# Altium project Zotino-DIOT.PrjPCB (part 3 of 5)

## Sheet DAC_32CH.SchDoc: DAC
size 420 x 297 mm; Author: G.K.; CompanyName: WUT; DrawnBy: G.K.; Organization: WUT ISE; Address1: Warsaw Univeristy of Technology; Address2: Nowowiejska 15/19; DocumentNumber: 3; Revision: 1.4.3; SheetNumber: 3; SheetTotal: 6; EDA_Number: ARTIQ; Projet: Zotino; ModifiedBy: -; CreateDate: XX/XX/XXXX; CheckedDate: -; Title2: & reference; DivGrp: ISE; Designer: G.K.; ModifiedDate: -; ProjectName: 32 CHANNEL 16bit DAC
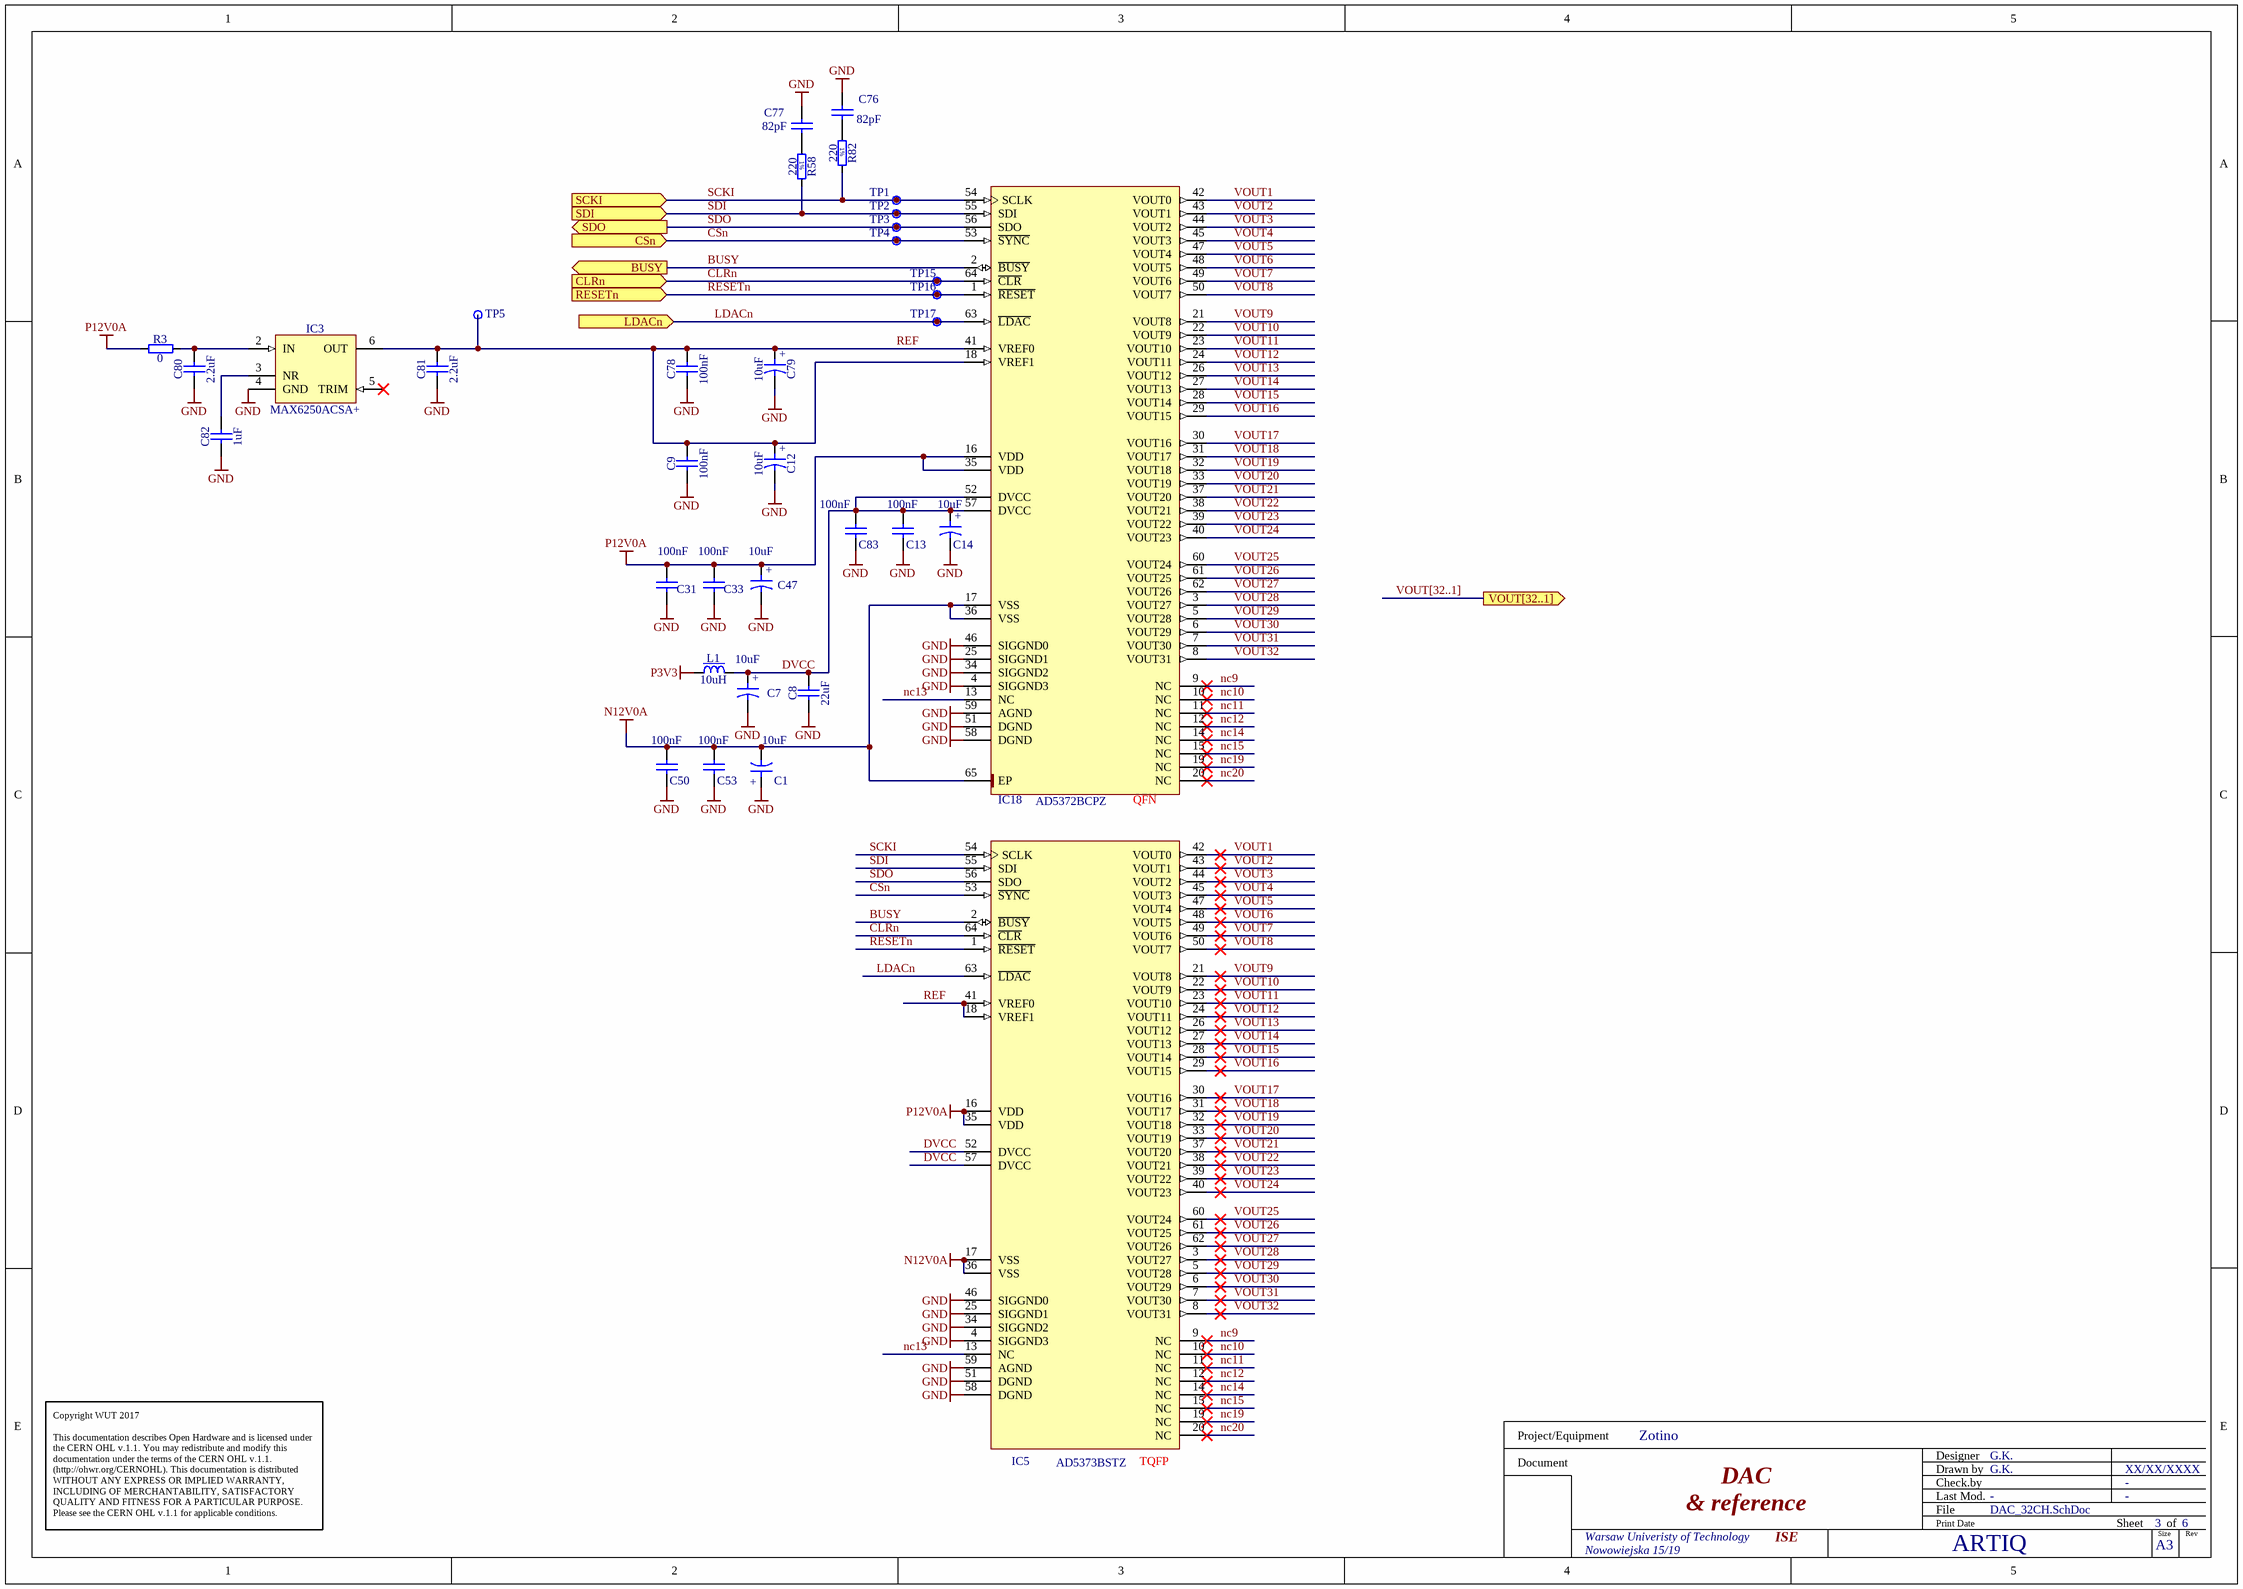
[diagram p3: DAC_32CH.SchDoc]

### Parts
C1  10uF  [CAPMP3216X180N]
C7  10uF  [CAPMP3216X180N]
C8  22uF  [CAPC2012X135N]
C9  100nF  [CAPC1005X55N]
C12  10uF  [CAPMP3216X180N]
C13  100nF  [CAPC1005X55N]
C14  10uF  [CAPMP3216X180N]
C31  100nF  [CAPC1005X55N]
C33  100nF  [CAPC1005X55N]
C47  10uF  [CAPMP3216X180N]
C50  100nF  [CAPC1005X55N]
C53  100nF  [CAPC1005X55N]
C76  82pF  [CAPC1608X87N]
C77  82pF  [CAPC1608X87N]
C78  100nF  [CAPC1005X55N]
C79  10uF  [CAPMP3216X180N]
C80  2.2uF  [CAPC1608X87N]
C81  2.2uF  [CAPC1608X87N]
C82  1uF  [CAPC1608X87N]
C83  100nF  [CAPC1005X55N]
IC3  MAX6250ACSA+  [SOIC127P600X175-8N]
IC5  AD5373BSTZ  [TSQFP50P1200X1200X160-64L]
IC18  AD5372BCPZ  [QFN50P900X900X100-65N-S725]
L1  10uH  [IND_MURATA-PS_8400]
R3  0  [RESC1005X40N]
R58  220  [RESC1608X55N]
R82  220  [RESC1608X55N]
TP1  Test Point  [TPS127]  (value not drawn)  (no BOM)
TP2  Test Point  [TPS127]  (value not drawn)  (no BOM)
TP3  Test Point  [TPS127]  (value not drawn)  (no BOM)
TP4  Test Point  [TPS127]  (value not drawn)  (no BOM)
TP5  Test Point  [TPS127]  (value not drawn)  (no BOM)
TP15  Test Point  [TPS127]  (value not drawn)  (no BOM)
TP16  Test Point  [TPS127]  (value not drawn)  (no BOM)
TP17  Test Point  [TPS127]  (value not drawn)  (no BOM)

### Ports
BUSY (out), CLRn (in), CSn (in), LDACn (in), RESETn (in), SCKI (in), SDI (in), SDO (out), VOUT[32..1] (out)

### Nets
GND: C1.1 C7.2 C8.1 C9.1 C12.2 C13.1 C14.2 C31.1 C33.1 C47.2 C50.1 C53.1 C76.1 C77.1 C78.1 C79.2 C80.1 C81.1 C82.1 C83.1 IC3.4(GND) IC5.4(SIGGND3) IC5.25(SIGGND1) IC5.34(SIGGND2) IC5.46(SIGGND0) IC5.51(DGND) IC5.58(DGND) IC5.59(AGND) IC18.4(SIGGND3) IC18.25(SIGGND1) IC18.34(SIGGND2) IC18.46(SIGGND0) IC18.51(DGND) IC18.58(DGND) IC18.59(AGND)
N12V0A: C1.2 C50.2 C53.2 IC5.17(VSS) IC5.36(VSS) IC18.17(VSS) IC18.36(VSS) IC18.65(EP)
P3V3: L1.1
P12V0A: C31.2 C33.2 C47.1 IC5.16(VDD) IC5.35(VDD) IC18.16(VDD) IC18.35(VDD) R3.1
BUSY: IC5.2(~{BUSY}) IC18.2(~{BUSY}) ; port BUSY
CLRn: IC5.64(~{CLR}) IC18.64(~{CLR}) TP15.1 ; port CLRn
CSn: IC5.53(~{SYNC}) IC18.53(~{SYNC}) TP4.1 ; port CSn
DVCC: C7.1 C8.2 C13.2 C14.1 C83.2 IC5.52(DVCC) IC5.57(DVCC) IC18.52(DVCC) IC18.57(DVCC) L1.2
LDACn: IC5.63(~{LDAC}) IC18.63(~{LDAC}) TP17.1 ; port LDACn
nc9: IC5.9(NC) IC18.9(NC)
nc10: IC5.10(NC) IC18.10(NC)
nc11: IC5.11(NC) IC18.11(NC)
nc12: IC5.12(NC) IC18.12(NC)
nc13: IC5.13(NC) IC18.13(NC)
nc14: IC5.14(NC) IC18.14(NC)
nc15: IC5.15(NC) IC18.15(NC)
nc19: IC5.19(NC) IC18.19(NC)
nc20: IC5.20(NC) IC18.20(NC)
REF: C9.2 C12.1 C78.2 C79.1 C81.2 IC3.6(OUT) IC5.18(VREF1) IC5.41(VREF0) IC18.18(VREF1) IC18.41(VREF0) TP5.1
RESETn: IC5.1(~{RESET}) IC18.1(~{RESET}) TP16.1 ; port RESETn
SCKI: IC5.54(SCLK) IC18.54(SCLK) R82.2 TP1.1 ; port SCKI
SDI: IC5.55(SDI) IC18.55(SDI) R58.2 TP2.1 ; port SDI
SDO: IC5.56(SDO) IC18.56(SDO) TP3.1 ; port SDO
VOUT1: IC5.42(VOUT0) IC18.42(VOUT0)
VOUT2: IC5.43(VOUT1) IC18.43(VOUT1)
VOUT3: IC5.44(VOUT2) IC18.44(VOUT2)
VOUT4: IC5.45(VOUT3) IC18.45(VOUT3)
VOUT5: IC5.47(VOUT4) IC18.47(VOUT4)
VOUT6: IC5.48(VOUT5) IC18.48(VOUT5)
VOUT7: IC5.49(VOUT6) IC18.49(VOUT6)
VOUT8: IC5.50(VOUT7) IC18.50(VOUT7)
VOUT9: IC5.21(VOUT8) IC18.21(VOUT8)
VOUT10: IC5.22(VOUT9) IC18.22(VOUT9)
VOUT11: IC5.23(VOUT10) IC18.23(VOUT10)
VOUT12: IC5.24(VOUT11) IC18.24(VOUT11)
VOUT13: IC5.26(VOUT12) IC18.26(VOUT12)
VOUT14: IC5.27(VOUT13) IC18.27(VOUT13)
VOUT15: IC5.28(VOUT14) IC18.28(VOUT14)
VOUT16: IC5.29(VOUT15) IC18.29(VOUT15)
VOUT17: IC5.30(VOUT16) IC18.30(VOUT16)
VOUT18: IC5.31(VOUT17) IC18.31(VOUT17)
VOUT19: IC5.32(VOUT18) IC18.32(VOUT18)
VOUT20: IC5.33(VOUT19) IC18.33(VOUT19)
VOUT21: IC5.37(VOUT20) IC18.37(VOUT20)
VOUT22: IC5.38(VOUT21) IC18.38(VOUT21)
VOUT23: IC5.39(VOUT22) IC18.39(VOUT22)
VOUT24: IC5.40(VOUT23) IC18.40(VOUT23)
VOUT25: IC5.60(VOUT24) IC18.60(VOUT24)
VOUT26: IC5.61(VOUT25) IC18.61(VOUT25)
VOUT27: IC5.62(VOUT26) IC18.62(VOUT26)
VOUT28: IC5.3(VOUT27) IC18.3(VOUT27)
VOUT29: IC5.5(VOUT28) IC18.5(VOUT28)
VOUT30: IC5.6(VOUT29) IC18.6(VOUT29)
VOUT31: IC5.7(VOUT30) IC18.7(VOUT30)
VOUT32: IC5.8(VOUT31) IC18.8(VOUT31)
NetC76_2: C76.2 R82.1
NetC77_2: C77.2 R58.1
NetC80_2: C80.2 IC3.2(IN) R3.2
NetC82_2: C82.2 IC3.3(NR)

Not connected (* = marked no-connect by the designer): IC3 5(TRIM)*

### Buses and harness runs
bus VOUT[32..1] = port VOUT[32..1]

### Notes on the sheet
- (near IC18) QFN
- (near IC5) TQFP
- Copyright WUT 2017
  This documentation describes Open Hardware and is licensed under the CERN OHL v.1.1. You may redistribute and modify this documentation under the terms of the CERN OHL v.1.1. (http://ohwr.org/CERNOHL). This documentation is distributed WITHOUT ANY EXPRESS OR IMPLIED WARRANTY, INCLUDING OF MERCHANTABILITY, SATISFACTORY QUALITY AND FITNESS FOR A PARTICULAR PURPOSE. Please see the CERN OHL v.1.1 for applicable conditions.
- Project/Equipment
- Document
- Designer
- Drawn by
- Check.by
- File
- Last Mod.
- Print Date
- Sheet
- Size
- A3
- of
- Rev
- (in symbol CTE3216-18_10UF_16V_20%_AVX_TCJ) +
- (in symbol R0603_220R_1%_0.1W_100PPM) 1%

### Library data of the parts
C1 C7 C12 C14 C47 C79 = CTE3216-18_10UF_16V_20%_AVX_TCJ: Polarised capacitor; Part Description: ESR 0R200 Tantalum Solid Electrolytic Chip Capacitor with Conductive Polymer Electrode; Manufacturer: AVX; Manufacturer Part Number: TCJA106M016R0200; Voltage: 16V; Tolerance: ±20%; Part Number: CTE3216-18_10UF_16V_20%_AVX_TCJ; Component Kind: Standard; Component Type: Standard; Pin Count: 2; Value: 10uF; Status: Preferred; Case: A; Mounted: Yes; Socket: No; SMD: Yes; Sense: No; ComponentHeight: 1.8mm; HelpURL: \\cern.ch\dfs\Applications\Altium\Datasheets\CTE_AVX_TCJ.pdf; Author: CERN DEM JLC; CreateDate: 29.03.2012; LatestRevisionDate: 29.03.2012
C8 = CC0805_22UF_16V_10%_X5R: Non-polarised capacitor; Part Description: SMD Multilayer Chip Ceramic Capacitor; Manufacturer: GENERIC; Manufacturer1 Part Number: C2012X5R1C226KT; Voltage: 16V; TC: X5R; Tolerance: ±10%; Part Number: CC0805_22UF_16V_10%_X5R; Component Kind: Standard; Component Type: Standard; Pin Count: 2; Value: 22uF; Status: Preferred; Manufacturer Part Number: CC0805_22UF_16V_10%_X5R; Case: 0805; Mounted: Yes; Socket: No; SMD: Yes; Sense: No; Manufacturer1 Example: TDK; Manufacturer1 ComponentHeight: 1.35mm; HelpURL: \\cern.ch\dfs\Applications\Altium\Datasheets\CC0805_X5R_TDK_C.pdf; Author: CERN DEM JLC; CreateDate: 25.10.2012; LatestRevisionDate: 25.10.2012
C9 C13 C31 C33 C50 C53 C78 C83 = CC0402_100NF_16V_10%_X7R: Non-polarised capacitor; Part Description: SMD Multilayer Chip Ceramic Capacitor; Manufacturer: GENERIC; Manufacturer1 Part Number: GRM155R71C104KA88D; Voltage: 16V; TC: X7R; Tolerance: ±10%; Part Number: CC0402_100NF_16V_10%_X7R; Component Kind: Standard; Component Type: Standard; Pin Count: 2; Value: 100nF; Status: Not Recommended; Manufacturer Part Number: CC0402_100NF_16V_10%_X7R; Case: 0402; Mounted: Yes; Socket: No; SMD: Yes; Sense: No; Manufacturer1 Example: MURATA; Manufacturer1 ComponentHeight: 0.55mm; HelpURL: \\cern.ch\dfs\Applications\Altium\Datasheets\CC0402_X7R_MURATA_GRM.pdf; Author: CERN DEM JLC
  C9 C78: CreateDate: 2013-12-05; LatestRevisionDate: 2007-12-03
  C13 C31 C33 C50 C53 C83: CreateDate: 05.12.2013; LatestRevisionDate: 03.12.2007
C76 C77 = CC0603_82PF_50V_5%_NP0: Non-polarised capacitor; Part Description: SMD Multilayer Chip Ceramic Capacitor; Manufacturer: GENERIC; Manufacturer1 Part Number: 223886715829; Voltage: 50V; TC: C0G/NP0; Tolerance: ±5%; Part Number: CC0603_82PF_50V_5%_NP0; Component Kind: Standard; Component Type: Standard; Pin Count: 2; Value: 82pF; Status: Preferred; Manufacturer Part Number: CC0603_82PF_50V_5%_NP0; Case: 0603; Mounted: Yes; Socket: No; SMD: Yes; Sense: No; Manufacturer1 Example: PHYCOMP; Manufacturer1 ComponentHeight: 0.87mm; HelpURL: \\cern.ch\dfs\Applications\Altium\Datasheets\CC0603_NP0_PHYCOMP.pdf; Author: CERN DEM JLC; CreateDate: 03.12.2007; LatestRevisionDate: 03.12.2007
C80 C81 = CC0603_2.2UF_16V_10%_X5R: Non-polarised capacitor; Part Description: SMD Multilayer Chip Ceramic Capacitor; Manufacturer: GENERIC; Manufacturer1 Part Number: CC0603KRX5R7BB225; Voltage: 16V; TC: X5R; Tolerance: ±10%; Part Number: CC0603_2.2UF_16V_10%_X5R; Component Kind: Standard; Component Type: Standard; Pin Count: 2; Value: 2.2uF; Status: Preferred; Manufacturer Part Number: CC0603_2.2UF_16V_10%_X5R; Case: 0603; Mounted: Yes; Socket: No; SMD: Yes; Sense: No; Manufacturer1 Example: YAGEO; Manufacturer1 ComponentHeight: 0.9mm; HelpURL: \\cern.ch\dfs\Applications\Altium\Datasheets\CC0805_X5R_PHYCOMP_HC.pdf; Author: CERN DEM JLC; CreateDate: 28.04.2011; LatestRevisionDate: 28.04.2011
C82 = CC0603_1UF_25V_10%_X7R: Non-polarised capacitor; Part Description: SMD Multilayer Chip Ceramic Capacitor; Manufacturer: GENERIC; Manufacturer1 Part Number: GRM188R71E105KA12D; Voltage: 25V; TC: X7R; Tolerance: ±10%; Part Number: CC0603_1UF_25V_10%_X7R; Component Kind: Standard; Component Type: Standard; Pin Count: 2; Value: 1uF; Status: None; Manufacturer Part Number: CC0603_1UF_25V_10%_X7R; Case: 0603; Mounted: Yes; Socket: No; SMD: Yes; Sense: No; Manufacturer1 Example: MURATA; Manufacturer1 ComponentHeight: 0.9mm; HelpURL: \\cern.ch\dfs\Applications\Altium\Datasheets\CC0603_X7R_MURATA.pdf; Author: CERN DEM JLC; CreateDate: 18.01.2011; LatestRevisionDate: 18.01.2011
IC3 = MAX6250ACSA+: 1ppm/°C, Low-Noise, Precision, +5.000V Voltage Reference; Manufacturer: MAXIM; PressFit: No; Bonding: No; Part Number: MAX6250ACSA+; Component Kind: Standard; Component Type: Standard; Device: MAX6250ACSA+; PackageDescription: SOIC 8, Pitch 1.27mm, Body 4x5mm, IPC Medium Density; Part Description: 1ppm/°C, Low-Noise, Precision, +5.000V Voltage Reference; Manufacturer Part Number: MAX6250ACSA+; Pin Count: 5; Case: SOIC8; Mounted: Yes; Socket: No; SMD: Yes; Sense: No; ComponentHeight: 1.75mm; HelpURL: \\cern.ch\dfs\Applications\Altium\Datasheets\MAX6250ACSA+.pdf; Author: CERN DEM JMW; CreateDate: 06.07.2015; LatestRevisionDate: 06.07.2015
IC5 = DAC_AD5372_QFP: 32-Channel, 16-Bit, Serial Input, Voltage Output Digital-to-Analog Converter; Manufacturer: ANALOG DEVICES; PressFit: No; Bonding: No; Part Number: AD5373BSTZ; Component Kind: Standard; Component Type: Standard; Device: AD5373BSTZ; PackageDescription: TSQFP, 64-Leads, Body 10.00x10.00mm, Pitch 0.50mm, IPC High Density; Part Description: 32-Channel, 16-Bit, Serial Input, Voltage Output Digital-to-Analog Converter; Manufacturer Part Number: AD5373BSTZ; Pin Count: 64; Case: QFN64; Mounted: Yes; Socket: No; SMD: Yes; Sense: No; ComponentHeight: 1mm; Author: GK; HelpURL: \\cern.ch\dfs\Applications\Altium\Datasheets\AD5373BCPZ.pdf; CreateDate: 14.03.2017; LatestRevisionDate: 14.03.2017
IC18 = DAC_AD5372: 32-Channel, 16-Bit, Serial Input, Voltage Output Digital-to-Analog Converter; Manufacturer: ANALOG DEVICES; PressFit: No; Bonding: No; Part Number: AD5372BCPZ; Component Kind: Standard; Component Type: Standard; Device: AD5372BCPZ; PackageDescription: QFN, 0.50mm Pitch, Square; 64 Pin, 9.00mm L X 9.00mm W X 1.00mm H Body (7.25 X 7.25mm Thermal Tab), IPC Medium Density; Part Description: 32-Channel, 16-Bit, Serial Input, Voltage Output Digital-to-Analog Converter; Manufacturer Part Number: AD5372BCPZ; Pin Count: 65; Case: QFN64; Mounted: Yes; Socket: No; SMD: Yes; Sense: No; ComponentHeight: 1mm; Author: GK; HelpURL: \\cern.ch\dfs\Applications\Altium\Datasheets\AD5373BCPZ.pdf; CreateDate: 14.03.2017; LatestRevisionDate: 14.03.2017
L1 = IND_10UH_10%_MURATA-PS_8400: Inductor With Core; Part Description: Miniature Surface Mount Power Inductor (8400 Serie); Manufacturer: MURATA POWER SOLUTIONS; Manufacturer Part Number: 84103C; Power: 950mA; Resistance: 0.24R; Tolerance: ±10%; Part Number: IND_10UH_10%_MURATA-PS_8400; Component Kind: Standard; Component Type: Standard; Pin Count: 2; Value: 10uH; Status: None; Mounted: Yes; Socket: No; SMD: Yes; Sense: No; ComponentHeight: 2.9mm; HelpURL: \\cern.ch\dfs\Applications\Altium\Datasheets\IND_MURATA-PS_8400.pdf; Author: CERN DEM JLC; CreateDate: 02.07.2012; LatestRevisionDate: 02.07.2012
R3 = R0402_0R_JUMPER: as R2 on sheet Supply_DAC; Part Number: R0402_0R_JUMPER; Component Kind: Standard; Component Type: Standard; Pin Count: 2; Value: 0; Status: Not recommended; Manufacturer Part Number: R0402_0R_JUMPER; Case: 0402; Mounted: Yes; Sense: No; Socket: No; SMD: Yes; Manufacturer1 Example: YAGEO PHYCOMP; Manufacturer1 ComponentHeight: 0.4mm; HelpURL: \\cern.ch\dfs\Applications\Altium\Datasheets\R0402_Phycomp_RC0402.pdf; Author: CERN DEM JLC; CreateDate: 03.12.2007; LatestRevisionDate: 17.10.2012
R58 R82 = R0603_220R_1%_0.1W_100PPM: Resistor - 1%; Part Description: General Purpose Thick Film Chip Resistor; Manufacturer: GENERIC; Manufacturer1 Part Number: NRC06F2200TRF; Power: 0.1W; TC: ±100ppm/°C; Part Number: R0603_220R_1%_0.1W_100PPM; Component Kind: Standard; Component Type: Standard; Pin Count: 2; Value: 220; Status: Preferred; Tolerance: ±1%; Manufacturer Part Number: R0603_220R_1%_0.1W_100PPM; Case: 0603; Mounted: Yes; Sense: No; Socket: No; SMD: Yes; Manufacturer1 Example: NIC COMPONENT; Manufacturer1 ComponentHeight: 0.55mm; HelpURL: \\cern.ch\dfs\Applications\Altium\Datasheets\R0603_NIC_NRC.pdf; Author: CERN DEM JLC; CreateDate: 03.12.2007; LatestRevisionDate: 13.03.2008
TP1-TP5 TP15-TP17 = SMD_PAD_1.27X1.27MM: as TP18 on sheet Zotino-DIOT; Part Number: SMD_PAD_1.27X1.27MM; Component Type: Standard (No BOM); Pin Count: 1; Family: Test Point; Socket: No; SMD: Yes; Sense: No; Status: None; ComponentHeight: 0mm; HelpURL: Undefined; Author: CERN DEM JLC; CreateDate: 12.01.2008; LatestRevisionDate: 12.01.2008; PackageDescription: 1.27mm x 1.27mm PCB Copper Area (SMD Test Point)

## Sheet LVDS_IFC_DAC.SchDoc: LVDS & I2C
size 420 x 297 mm; Author: G.K.; CompanyName: WUT; DrawnBy: G.K.; Organization: WUT ISE; Address1: Warsaw Univeristy of Technology; Address2: Nowowiejska 15/19; DocumentNumber: 2; Revision: 1.4.3; SheetNumber: 2; SheetTotal: 6; EDA_Number: ARTIQ; Projet: Zotino; ModifiedBy: -; CreateDate: XX/XX/XXXX; CheckedDate: -; Title2: interfaces; DivGrp: ISE; Designer: G.K.; SPICEModelCache: <root> / <DocumentId>IUEWJVWM</DocumentId> / <CacheFrame Number="0"> / <Model Name="pk14" Kind="CKT"> / <Text>*.INC dhvqfn.s / .SUBCKT pk14 / +    1   2   3   4   5   6   7   8   9  10 / +   11  12  13  14 / +   15  16  17  18  19  20  21  22  23  24 / +   25  26  27  28 / * Pin Resistance / r1 1 1001 9.078E-02 / r2 2 1002 8.829E-02 / r3 3 1003 8.731E-02 / r4 4 1004 8.710E-02 / r5 5 1005 8.731E-02 / r6 6 1006 8.829E-02 / r7 7 1007 9.075E-02 / r8 8 1008 9.072E-02 / r9 9 1009 8.809E-02 / r10 10 1010 8.716E-02 / r11 11 1011 8.706E-02 / r12 12 1012 8.720E-02 / r13 13 1013 8.816E-02 / r14 14 1014 9.068E-02 / * Pin Inductance / l1 1001 15 2.981E-09 / l2 1002 16 2.447E-09 / l3 1003 17 2.304E-09 / l4 1004 18 2.291E-09 / l5 1005 19 2.307E-09 / l6 1006 20 2.449E-09 / l7 1007 21 2.971E-09 / l8 1008 22 2.972E-09 / l9 1009 23 2.425E-09 / l10 1010 24 2.286E-09 / l11 1011 25 2.280E-09 / l12 1012 26 2.286E-09 / l13 1013 27 2.425E-09 / l14 1014 28 2.975E-09 / .ENDS pk14</Text> / </Model> / </CacheFrame> / </root>; ModifiedDate: -; ProjectName: 32 CHANNEL 16bit DAC
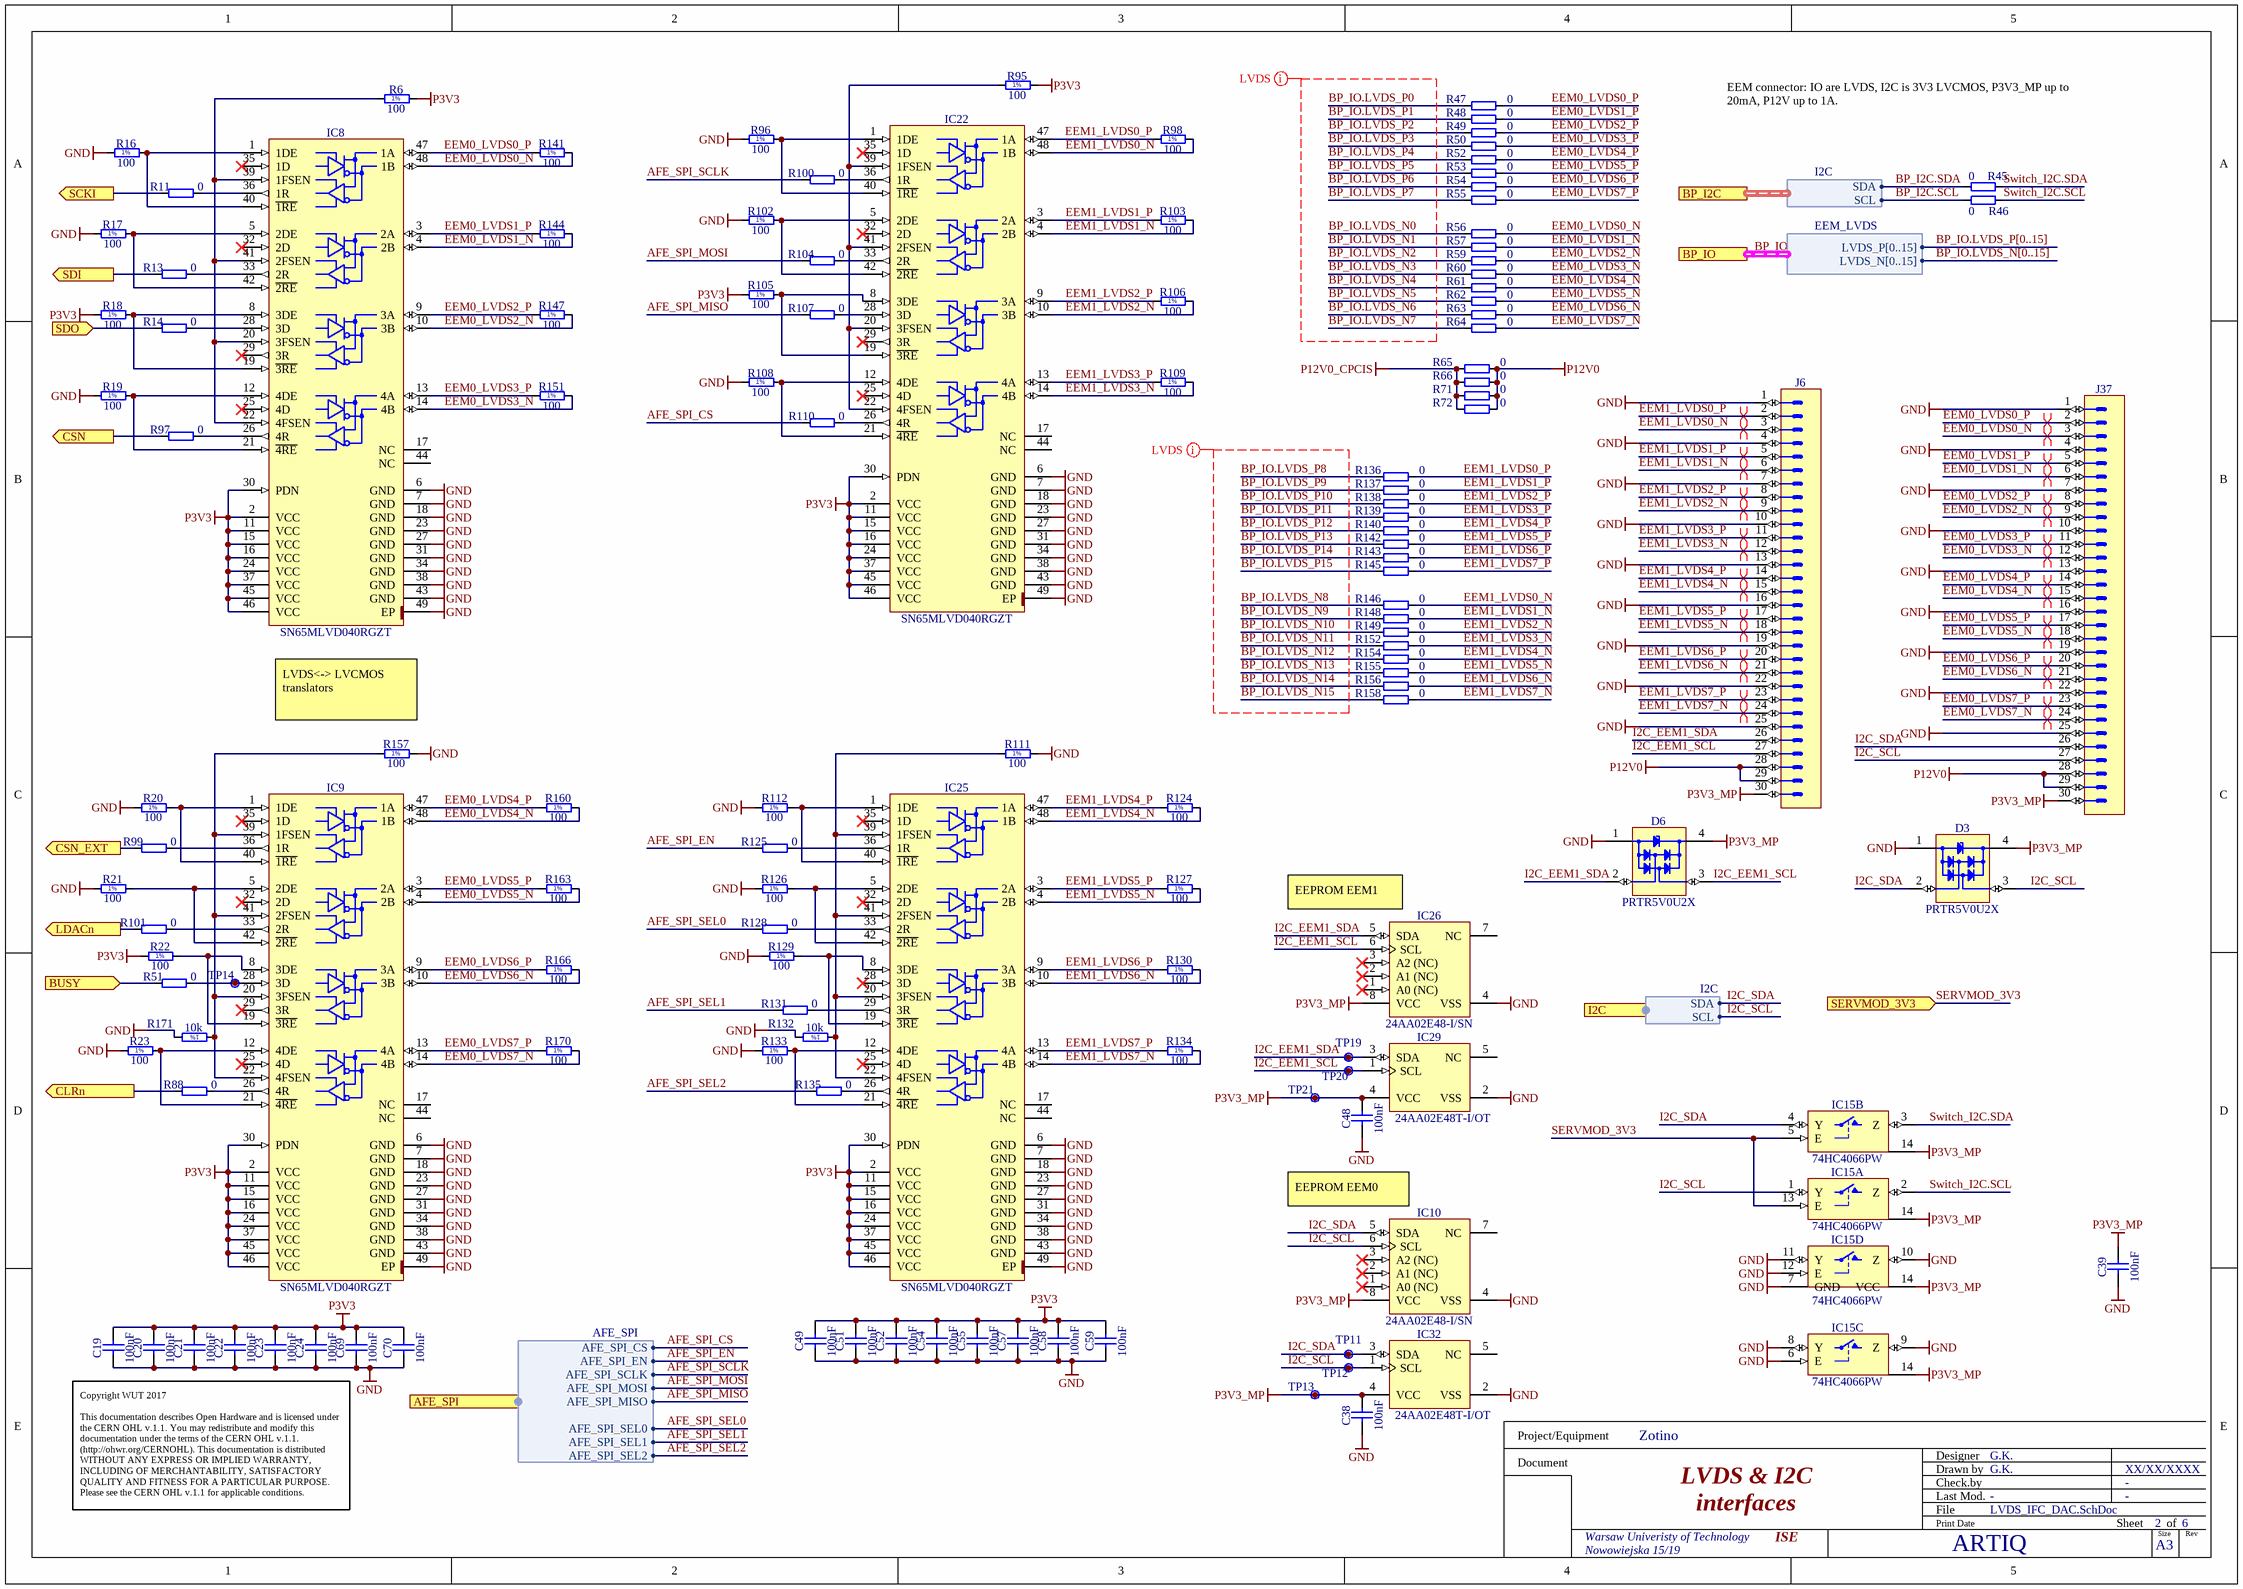
[diagram p4: LVDS_IFC_DAC.SchDoc]

### Parts
C19  100nF  [CAPC1005X55N]
C20  100nF  [CAPC1005X55N]
C21  100nF  [CAPC1005X55N]
C22  100nF  [CAPC1005X55N]
C23  100nF  [CAPC1005X55N]
C24  100nF  [CAPC1005X55N]
C38  100nF  [CAPC1005X55N]
C39  100nF  [CAPC1005X55N]
C48  100nF  [CAPC1005X55N]
C49  100nF  [CAPC1005X55N]
C51  100nF  [CAPC1005X55N]
C52  100nF  [CAPC1005X55N]
C54  100nF  [CAPC1005X55N]
C55  100nF  [CAPC1005X55N]
C57  100nF  [CAPC1005X55N]
C58  100nF  [CAPC1005X55N]
C59  100nF  [CAPC1005X55N]
C69  100nF  [CAPC1005X55N]
C70  100nF  [CAPC1005X55N]
D3  PRTR5V0U2X  [SOT190P230X110-4N]
D6  PRTR5V0U2X  [SOT190P230X110-4N]
IC8  SN65MLVD040RGZT  [QFN50P700X700X100-49N-S420]
IC9  SN65MLVD040RGZT  [QFN50P700X700X100-49N-S420]
IC10  24AA02E48-I/SN  [SOIC127P600X175-8N]
IC15  74HC4066PW  [SOP65P640X110-14N]  (parts A,B,C,D of 4)
IC22  SN65MLVD040RGZT  [QFN50P700X700X100-49N-S420]
IC25  SN65MLVD040RGZT  [QFN50P700X700X100-49N-S420]
IC26  24AA02E48-I/SN  [SOIC127P600X175-8N]
IC29  24AA02E48T-I/OT  [SOT95P280X145-5N]
IC32  24AA02E48T-I/OT  [SOT95P280X145-5N]
J6  (no value)  [3M_N2530-6002RB]
J37  (no value)  [3M_N2530-6002RB]
R6  100  [RESC1005X40N]
R11  0  [RESC1005X40N]
R13  0  [RESC1005X40N]
R14  0  [RESC1005X40N]
R16  100  [RESC1005X40N]
R17  100  [RESC1005X40N]
R18  100  [RESC1005X40N]
R19  100  [RESC1005X40N]
R20  100  [RESC1005X40N]
R21  100  [RESC1005X40N]
R22  100  [RESC1005X40N]
R23  100  [RESC1005X40N]
R45  0  [RESC1005X40N]
R46  0  [RESC1005X40N]
R47  0  [RESC1005X40N]
R48  0  [RESC1005X40N]
R49  0  [RESC1005X40N]
R50  0  [RESC1005X40N]
R51  0  [RESC1005X40N]
R52  0  [RESC1005X40N]
R53  0  [RESC1005X40N]
R54  0  [RESC1005X40N]
R55  0  [RESC1005X40N]
R56  0  [RESC1005X40N]
R57  0  [RESC1005X40N]
R59  0  [RESC1005X40N]
R60  0  [RESC1005X40N]
R61  0  [RESC1005X40N]
R62  0  [RESC1005X40N]
R63  0  [RESC1005X40N]
R64  0  [RESC1005X40N]
R65  0  [RESC1005X40N]
R66  0  [RESC1005X40N]
R71  0  [RESC1005X40N]
R72  0  [RESC1005X40N]
R88  0  [RESC1005X40N]
R95  100  [RESC1005X40N]
R96  100  [RESC1005X40N]
R97  0  [RESC1005X40N]
R98  100  [RESC1005X40N]
R99  0  [RESC1005X40N]
R100  0  [RESC1005X40N]
R101  0  [RESC1005X40N]
R102  100  [RESC1005X40N]
R103  100  [RESC1005X40N]
R104  0  [RESC1005X40N]
R105  100  [RESC1005X40N]
R106  100  [RESC1005X40N]
R107  0  [RESC1005X40N]
R108  100  [RESC1005X40N]
R109  100  [RESC1005X40N]
R110  0  [RESC1005X40N]
R111  100  [RESC1005X40N]
R112  100  [RESC1005X40N]
R124  100  [RESC1005X40N]
R125  0  [RESC1005X40N]
R126  100  [RESC1005X40N]
R127  100  [RESC1005X40N]
R128  0  [RESC1005X40N]
R129  100  [RESC1005X40N]
R130  100  [RESC1005X40N]
R131  0  [RESC1005X40N]
R132  10k  [RESC1005X40N]
R133  100  [RESC1005X40N]
R134  100  [RESC1005X40N]
R135  0  [RESC1005X40N]
R136  0  [RESC1005X40N]
R137  0  [RESC1005X40N]
R138  0  [RESC1005X40N]
R139  0  [RESC1005X40N]
R140  0  [RESC1005X40N]
R141  100  [RESC1005X40N]
R142  0  [RESC1005X40N]
R143  0  [RESC1005X40N]
R144  100  [RESC1005X40N]
R145  0  [RESC1005X40N]
R146  0  [RESC1005X40N]
R147  100  [RESC1005X40N]
R148  0  [RESC1005X40N]
R149  0  [RESC1005X40N]
R151  100  [RESC1005X40N]
R152  0  [RESC1005X40N]
R154  0  [RESC1005X40N]
R155  0  [RESC1005X40N]
R156  0  [RESC1005X40N]
R157  100  [RESC1005X40N]
R158  0  [RESC1005X40N]
R160  100  [RESC1005X40N]
R163  100  [RESC1005X40N]
R166  100  [RESC1005X40N]
R170  100  [RESC1005X40N]
R171  10k  [RESC1005X40N]
TP11  Test Point  [TPS127]  (value not drawn)  (no BOM)
TP12  Test Point  [TPS127]  (value not drawn)  (no BOM)
TP13  Test Point  [TPS127]  (value not drawn)  (no BOM)
TP14  Test Point  [TPS127]  (value not drawn)  (no BOM)
TP19  Test Point  [TPS127]  (value not drawn)  (no BOM)
TP20  Test Point  [TPS127]  (value not drawn)  (no BOM)
TP21  Test Point  [TPS127]  (value not drawn)  (no BOM)

### Ports
AFE_SPI (harness AFE_SPI), BP_I2C (harness I2C), BP_IO (harness EEM_LVDS), BUSY (in), CLRn (out), CSN (out), CSN_EXT (out), I2C (harness I2C), LDACn (out), SCKI (out), SDI (out), SDO (in), SERVMOD_3V3 (in)

### Harnesses
I2C: SDA, SCL
EEM_LVDS: LVDS_P[0..15], LVDS_N[0..15]
AFE_SPI: AFE_SPI_CS, AFE_SPI_EN, AFE_SPI_SCLK, AFE_SPI_MOSI, AFE_SPI_MISO, AFE_SPI_SEL0, AFE_SPI_SEL1, AFE_SPI_SEL2

### Nets
GND: C19.1 C20.1 C21.1 C22.1 C23.1 C24.1 C38.1 C39.1 C48.1 C49.1 C51.1 C52.1 C54.1 C55.1 C57.1 C58.1 C59.1 C69.1 C70.1 D3.1(GND) D6.1(GND) IC8.6(GND) IC8.7(GND) IC8.18(GND) IC8.23(GND) IC8.27(GND) IC8.31(GND) IC8.34(GND) IC8.38(GND) IC8.43(GND) IC8.49(EP) IC9.6(GND) IC9.7(GND) IC9.18(GND) IC9.23(GND) IC9.27(GND) IC9.31(GND) IC9.34(GND) IC9.38(GND) IC9.43(GND) IC9.49(EP) IC10.4(VSS) IC15.6(E) IC15.7(GND) IC15.8(Y) IC15.9(Z) IC15.10(Z) IC15.11(Y) IC15.12(E) IC22.6(GND) IC22.7(GND) IC22.18(GND) IC22.23(GND) IC22.27(GND) IC22.31(GND) IC22.34(GND) IC22.38(GND) IC22.43(GND) IC22.49(EP) IC25.6(GND) IC25.7(GND) IC25.18(GND) IC25.23(GND) IC25.27(GND) IC25.31(GND) IC25.34(GND) IC25.38(GND) IC25.43(GND) IC25.49(EP) IC26.4(VSS) IC29.2(VSS) IC32.2(VSS) J6.1 J6.4 J6.7 J6.10 J6.13 J6.16 J6.19 J6.22 J6.25 J37.1 J37.4 J37.7 J37.10 J37.13 J37.16 J37.19 J37.22 J37.25 R16.1 R17.1 R19.1 R20.1 R21.1 R23.1 R96.1 R102.1 R108.1 R111.2 R112.1 R126.1 R129.1 R132.2 R133.1 R157.2 R171.2
P3V3: C19.2 C20.2 C21.2 C22.2 C23.2 C24.2 C49.2 C51.2 C52.2 C54.2 C55.2 C57.2 C58.2 C59.2 C69.2 C70.2 IC8.2(VCC) IC8.11(VCC) IC8.15(VCC) IC8.16(VCC) IC8.24(VCC) IC8.30(PDN) IC8.37(VCC) IC8.45(VCC) IC8.46(VCC) IC9.2(VCC) IC9.11(VCC) IC9.15(VCC) IC9.16(VCC) IC9.24(VCC) IC9.30(PDN) IC9.37(VCC) IC9.45(VCC) IC9.46(VCC) IC22.2(VCC) IC22.11(VCC) IC22.15(VCC) IC22.16(VCC) IC22.24(VCC) IC22.30(PDN) IC22.37(VCC) IC22.45(VCC) IC22.46(VCC) IC25.2(VCC) IC25.11(VCC) IC25.15(VCC) IC25.16(VCC) IC25.24(VCC) IC25.30(PDN) IC25.37(VCC) IC25.45(VCC) IC25.46(VCC) R6.2 R18.1 R22.1 R95.2 R105.1
P3V3_MP: C38.2 C39.2 C48.2 D3.4(VCC) D6.4(VCC) IC10.8(VCC) IC15.14(VCC) IC26.8(VCC) IC29.4(VCC) IC32.4(VCC) J6.30 J37.30 TP13.1 TP21.1
P12V0: J6.28 J6.29 J37.28 J37.29 R65.2 R66.2 R71.2 R72.2
P12V0_CPCIS: R65.1 R66.1 R71.1 R72.1
AFE_SPI_CS: R110.1 ; port AFE_SPI.AFE_SPI_CS
AFE_SPI_EN: R125.1 ; port AFE_SPI.AFE_SPI_EN
AFE_SPI_MISO: R107.1 ; port AFE_SPI.AFE_SPI_MISO
AFE_SPI_MOSI: R104.1 ; port AFE_SPI.AFE_SPI_MOSI
AFE_SPI_SCLK: R100.1 ; port AFE_SPI.AFE_SPI_SCLK
AFE_SPI_SEL0: R128.1 ; port AFE_SPI.AFE_SPI_SEL0
AFE_SPI_SEL1: R131.1 ; port AFE_SPI.AFE_SPI_SEL1
AFE_SPI_SEL2: R135.1 ; port AFE_SPI.AFE_SPI_SEL2
BP_I2C.SCL: R46.1 ; port BP_I2C.SCL
BP_I2C.SDA: R45.1 ; port BP_I2C.SDA
BP_IO.LVDS_N0: R56.1
BP_IO.LVDS_N1: R57.1
BP_IO.LVDS_N2: R59.1
BP_IO.LVDS_N3: R60.1
BP_IO.LVDS_N4: R61.1
BP_IO.LVDS_N5: R62.1
BP_IO.LVDS_N6: R63.1
BP_IO.LVDS_N7: R64.1
BP_IO.LVDS_N8: R146.1
BP_IO.LVDS_N9: R148.1
BP_IO.LVDS_N10: R149.1
BP_IO.LVDS_N11: R152.1
BP_IO.LVDS_N12: R154.1
BP_IO.LVDS_N13: R155.1
BP_IO.LVDS_N14: R156.1
BP_IO.LVDS_N15: R158.1
BP_IO.LVDS_P0: R47.1
BP_IO.LVDS_P1: R48.1
BP_IO.LVDS_P2: R49.1
BP_IO.LVDS_P3: R50.1
BP_IO.LVDS_P4: R52.1
BP_IO.LVDS_P5: R53.1
BP_IO.LVDS_P6: R54.1
BP_IO.LVDS_P7: R55.1
BP_IO.LVDS_P8: R136.1
BP_IO.LVDS_P9: R137.1
BP_IO.LVDS_P10: R138.1
BP_IO.LVDS_P11: R139.1
BP_IO.LVDS_P12: R140.1
BP_IO.LVDS_P13: R142.1
BP_IO.LVDS_P14: R143.1
BP_IO.LVDS_P15: R145.1
BUSY: R51.1 ; port BUSY
CLRn: R88.1 ; port CLRn
CSn: R97.1 ; port CSN
CSN_EXT: R99.1 ; port CSN_EXT
EEM0_LVDS0_N: IC8.48(1B) J37.3 R56.2 R141.2
EEM0_LVDS0_P: IC8.47(1A) J37.2 R47.2 R141.1
EEM0_LVDS1_N: IC8.4(2B) J37.6 R57.2 R144.2
EEM0_LVDS1_P: IC8.3(2A) J37.5 R48.2 R144.1
EEM0_LVDS2_N: IC8.10(3B) J37.9 R59.2 R147.2
EEM0_LVDS2_P: IC8.9(3A) J37.8 R49.2 R147.1
EEM0_LVDS3_N: IC8.14(4B) J37.12 R60.2 R151.2
EEM0_LVDS3_P: IC8.13(4A) J37.11 R50.2 R151.1
EEM0_LVDS4_N: IC9.48(1B) J37.15 R61.2 R160.2
EEM0_LVDS4_P: IC9.47(1A) J37.14 R52.2 R160.1
EEM0_LVDS5_N: IC9.4(2B) J37.18 R62.2 R163.2
EEM0_LVDS5_P: IC9.3(2A) J37.17 R53.2 R163.1
EEM0_LVDS6_N: IC9.10(3B) J37.21 R63.2 R166.2
EEM0_LVDS6_P: IC9.9(3A) J37.20 R54.2 R166.1
EEM0_LVDS7_N: IC9.14(4B) J37.24 R64.2 R170.2
EEM0_LVDS7_P: IC9.13(4A) J37.23 R55.2 R170.1
EEM1_LVDS0_N: IC22.48(1B) J6.3 R98.2 R146.2
EEM1_LVDS0_P: IC22.47(1A) J6.2 R98.1 R136.2
EEM1_LVDS1_N: IC22.4(2B) J6.6 R103.2 R148.2
EEM1_LVDS1_P: IC22.3(2A) J6.5 R103.1 R137.2
EEM1_LVDS2_N: IC22.10(3B) J6.9 R106.2 R149.2
EEM1_LVDS2_P: IC22.9(3A) J6.8 R106.1 R138.2
EEM1_LVDS3_N: IC22.14(4B) J6.12 R109.2 R152.2
EEM1_LVDS3_P: IC22.13(4A) J6.11 R109.1 R139.2
EEM1_LVDS4_N: IC25.48(1B) J6.15 R124.2 R154.2
EEM1_LVDS4_P: IC25.47(1A) J6.14 R124.1 R140.2
EEM1_LVDS5_N: IC25.4(2B) J6.18 R127.2 R155.2
EEM1_LVDS5_P: IC25.3(2A) J6.17 R127.1 R142.2
EEM1_LVDS6_N: IC25.10(3B) J6.21 R130.2 R156.2
EEM1_LVDS6_P: IC25.9(3A) J6.20 R130.1 R143.2
EEM1_LVDS7_N: IC25.14(4B) J6.24 R134.2 R158.2
EEM1_LVDS7_P: IC25.13(4A) J6.23 R134.1 R145.2
I2C_EEM1_SCL: D6.3(I/O2) IC26.6(SCL) IC29.1(SCL) J6.27 TP20.1
I2C_EEM1_SDA: D6.2(I/O1) IC26.5(SDA) IC29.3(SDA) J6.26 TP19.1
I2C_SCL: D3.3(I/O2) IC10.6(SCL) IC15.1(Y) IC32.1(SCL) J37.27 TP12.1 ; port I2C.SCL
I2C_SDA: D3.2(I/O1) IC10.5(SDA) IC15.4(Y) IC32.3(SDA) J37.26 TP11.1 ; port I2C.SDA
LDACn: R101.1 ; port LDACn
SCKI: R11.1 ; port SCKI
SDI: R13.1 ; port SDI
SDO: R14.1 ; port SDO
SERVMOD_3V3: IC15.5(E) IC15.13(E) ; port SERVMOD_3V3
Switch_I2C.SCL: IC15.2(Z) R46.2
Switch_I2C.SDA: IC15.3(Z) R45.2
NetIC8_1: IC8.1(1DE) IC8.40(~{1RE}) R16.2
NetIC8_5: IC8.5(2DE) IC8.42(~{2RE}) R17.2
NetIC8_8: IC8.8(3DE) IC8.19(~{3RE}) R18.2
NetIC8_12: IC8.12(4DE) IC8.21(~{4RE}) R19.2
NetIC8_20: IC8.20(3FSEN) IC8.22(4FSEN) IC8.39(1FSEN) IC8.41(2FSEN) R6.1
NetIC8_26: IC8.26(4R) R97.2
NetIC8_28: IC8.28(3D) R14.2
NetIC8_33: IC8.33(2R) R13.2
NetIC8_36: IC8.36(1R) R11.2
NetIC9_1: IC9.1(1DE) IC9.40(~{1RE}) R20.2
NetIC9_5: IC9.5(2DE) IC9.42(~{2RE}) R21.2
NetIC9_8: IC9.8(3DE) IC9.19(~{3RE}) R22.2
NetIC9_12: IC9.12(4DE) IC9.21(~{4RE}) R23.2
NetIC9_20: IC9.20(3FSEN) IC9.22(4FSEN) IC9.39(1FSEN) IC9.41(2FSEN) R157.1 R171.1
NetIC9_26: IC9.26(4R) R88.2
NetIC9_28: IC9.28(3D) R51.2 TP14.1
NetIC9_33: IC9.33(2R) R101.2
NetIC9_36: IC9.36(1R) R99.2
NetIC22_1: IC22.1(1DE) IC22.40(~{1RE}) R96.2
NetIC22_5: IC22.5(2DE) IC22.42(~{2RE}) R102.2
NetIC22_8: IC22.8(3DE) IC22.19(~{3RE}) R105.2
NetIC22_12: IC22.12(4DE) IC22.21(~{4RE}) R108.2
NetIC22_20: IC22.20(3FSEN) IC22.22(4FSEN) IC22.39(1FSEN) IC22.41(2FSEN) R95.1
NetIC22_26: IC22.26(4R) R110.2
NetIC22_28: IC22.28(3D) R107.2
NetIC22_33: IC22.33(2R) R104.2
NetIC22_36: IC22.36(1R) R100.2
NetIC25_1: IC25.1(1DE) IC25.40(~{1RE}) R112.2
NetIC25_5: IC25.5(2DE) IC25.42(~{2RE}) R126.2
NetIC25_8: IC25.8(3DE) IC25.19(~{3RE}) R129.2
NetIC25_12: IC25.12(4DE) IC25.21(~{4RE}) R133.2
NetIC25_20: IC25.20(3FSEN) IC25.22(4FSEN) IC25.39(1FSEN) IC25.41(2FSEN) R111.1 R132.1
NetIC25_26: IC25.26(4R) R135.2
NetIC25_29: IC25.29(3R) R131.2
NetIC25_33: IC25.33(2R) R128.2
NetIC25_36: IC25.36(1R) R125.2

Not connected (* = marked no-connect by the designer): IC8 17(NC) 25(4D)* 29(3R)* 32(2D)* 35(1D)* 44(NC); IC9 17(NC) 25(4D)* 29(3R)* 32(2D)* 35(1D)* 44(NC); IC10 1(A0_(NC))* 2(A1_(NC))* 3(A2_(NC))* 7(NC); IC22 17(NC) 25(4D)* 29(3R)* 32(2D)* 35(1D)* 44(NC); IC25 17(NC) 25(4D)* 28(3D)* 32(2D)* 35(1D)* 44(NC); IC26 1(A0_(NC))* 2(A1_(NC))* 3(A2_(NC))* 7(NC); IC29 5(NC); IC32 5(NC)

### Buses and harness runs
bus BP_IO.LVDS_N[0..15]
bus BP_IO.LVDS_P[0..15]
harness BP_IO = port BP_IO

### Layout directives
differential pair: EEM0_LVDS0_N, EEM0_LVDS0_P, EEM0_LVDS1_N, EEM0_LVDS1_P, EEM0_LVDS2_N, EEM0_LVDS2_P, EEM0_LVDS3_N, EEM0_LVDS3_P, EEM0_LVDS4_N, EEM0_LVDS4_P, EEM0_LVDS5_N, EEM0_LVDS5_P, EEM0_LVDS6_N, EEM0_LVDS6_P, EEM0_LVDS7_N, EEM0_LVDS7_P, EEM1_LVDS0_N, EEM1_LVDS0_P, EEM1_LVDS1_N, EEM1_LVDS1_P, EEM1_LVDS2_N, EEM1_LVDS2_P, EEM1_LVDS3_N, EEM1_LVDS3_P, EEM1_LVDS4_N, EEM1_LVDS4_P, EEM1_LVDS5_N, EEM1_LVDS5_P, EEM1_LVDS6_N, EEM1_LVDS6_P, EEM1_LVDS7_N, EEM1_LVDS7_P
net class LVDS: BP_IO.LVDS_N0, BP_IO.LVDS_N1, BP_IO.LVDS_N2, BP_IO.LVDS_N3, BP_IO.LVDS_N4, BP_IO.LVDS_N5, BP_IO.LVDS_N6, BP_IO.LVDS_N7, BP_IO.LVDS_N8, BP_IO.LVDS_N9, BP_IO.LVDS_N10, BP_IO.LVDS_N11, BP_IO.LVDS_N12, BP_IO.LVDS_N13, BP_IO.LVDS_N14, BP_IO.LVDS_N15, BP_IO.LVDS_P0, BP_IO.LVDS_P1, BP_IO.LVDS_P2, BP_IO.LVDS_P3, BP_IO.LVDS_P4, BP_IO.LVDS_P5, BP_IO.LVDS_P6, BP_IO.LVDS_P7, BP_IO.LVDS_P8, BP_IO.LVDS_P9, BP_IO.LVDS_P10, BP_IO.LVDS_P11, BP_IO.LVDS_P12, BP_IO.LVDS_P13, BP_IO.LVDS_P14, BP_IO.LVDS_P15

### Notes on the sheet
- EEM connector: IO are LVDS, I2C is 3V3 LVCMOS, P3V3_MP up to 20mA, P12V up to 1A.
- LVDS<-> LVCMOS translators
- (near IC26) EEPROM EEM1
- (near IC10) EEPROM EEM0
- Copyright WUT 2017
  This documentation describes Open Hardware and is licensed under the CERN OHL v.1.1. You may redistribute and modify this documentation under the terms of the CERN OHL v.1.1. (http://ohwr.org/CERNOHL). This documentation is distributed WITHOUT ANY EXPRESS OR IMPLIED WARRANTY, INCLUDING OF MERCHANTABILITY, SATISFACTORY QUALITY AND FITNESS FOR A PARTICULAR PURPOSE. Please see the CERN OHL v.1.1 for applicable conditions.
- Project/Equipment
- Document
- Designer
- Drawn by
- Check.by
- File
- Last Mod.
- Print Date
- Sheet
- Size
- A3
- of
- Rev
- (in symbol R0402_10K_1%_0.0625W_100PPM) 1%
- (in symbol R0402_100R_1%_0.1W_100PPM) 1%

### Library data of the parts
C19-C24 C38 C39 C48 C49 C51 C52 C54 C55 C57-C59 C69 C70 = CC0402_100NF_16V_10%_X5R: Non-polarised capacitor; Part Description: SMD Multilayer Chip Ceramic Capacitor; Manufacturer: GENERIC; Manufacturer1 Part Number: GRM155R61C104KA88D; Voltage: 16V; TC: X5R; Tolerance: ±10%; Part Number: CC0402_100NF_16V_10%_X5R; Component Kind: Standard; Component Type: Standard; Pin Count: 2; Value: 100nF; Status: None; Manufacturer Part Number: CC0402_100NF_16V_10%_X5R; Case: 0402; Mounted: Yes; Socket: No; SMD: Yes; Sense: No; Manufacturer1 Example: MURATA; Manufacturer1 ComponentHeight: 0.55mm; HelpURL: \\cern.ch\dfs\Applications\Altium\Datasheets\CC0402_X5R_MURATA_GRM.pdf; Author: CERN DEM JLC; CreateDate: 10.12.2013; LatestRevisionDate: 10.12.2013
D3 D6 = PRTR5V0U2X: Ultra Low Capacitance Double Rail-to-Rail ESD Protection Diode; Part Description: Ultra Low Capacitance (1pF) Double Rail-to-Rail ESD Protection Diode (8kV); Manufacturer: NXP SEMICONDUCTORS; Voltage: 5.5V; PressFit: No; Bonding: No; Part Number: PRTR5V0U2X; Component Kind: Standard; Component Type: Standard; Device: PRTR5V0U2X; PackageDescription: SOT143B, SOT, 1.90mm Pitch; 4 Pin, 1.30mm W X 2.90mm L X 1.10mm H body, IPC Medium Density; Manufacturer Part Number: PRTR5V0U2X; Pin Count: 4; Case: SOT143B; Mounted: Yes; Socket: No; SMD: Yes; Sense: No; ComponentHeight: 1.1mm; HelpURL: \\cern.ch\dfs\Applications\Altium\Datasheets\PRTR5V0U2X.pdf; Author: CERN DEM JLC; CreateDate: 22.03.2011; LatestRevisionDate: 22.03.2011
IC8 IC9 IC22 IC25 = SN65MLVD040RGZT: 4-Channel Half-Duplex M-LVDS Line Transceiver; Manufacturer: TEXAS INSTRUMENTS; PressFit: No; Bonding: No; Part Number: SN65MLVD040RGZT; Component Kind: Standard; Component Type: Standard; Device: SN65MLVD040RGZT; PackageDescription: QFN, 0.50mm Pitch, Square; 48 Pin, 7.00mm L X 7.00mm W X 1mm H body (W/Thermal Tab 4.2mm X 4.2mm), IPC Medium Density; Part Description: 4-Channel Half-Duplex M-LVDS Line Transceiver; Manufacturer Part Number: SN65MLVD040RGZT; Pin Count: 49; Case: QFN48; Mounted: Yes; Socket: No; SMD: Yes; Sense: No; ComponentHeight: 1mm; Author: CERN DEM JLC; HelpURL: \\cern.ch\dfs\Applications\Altium\Datasheets\SN65MLVD040RGZT.pdf; CreateDate: 17.03.2011; LatestRevisionDate: 17.03.2011
IC10 IC26 = 24AA02E48-I/SN: 1.7V-5.5V, 2K I2C™ Serial EEPROMs with EUI-48™ Node Identity; Manufacturer: MICROCHIP TECHNOLOGY; PressFit: No; Bonding: No; Part Number: 24AA02E48-I/SN; Component Kind: Standard; Component Type: Standard; Device: 24AA02E48-I/SN; PackageDescription: SOIC, 1.27mm Pitch; 8 Pin - Body 4x5mm, IPC Medium Density; Part Description: 1.7V-5.5V, 2K I2C™ Serial EEPROMs with EUI-48™ Node Identity; Manufacturer Part Number: 24AA02E48-I/SN; Pin Count: 8; Case: SOIC8; Mounted: Yes; Socket: No; SMD: Yes; Sense: No; ComponentHeight: 1.75mm; HelpURL: \\cern.ch\dfs\Applications\Altium\Datasheets\24AA025E48-I-SN.pdf; Author: CERN DEM MR; CreateDate: 19.07.2016; LatestRevisionDate: 19.07.2016
IC15 = 74HC4066PW: Part Description: Quad Single-Pole Single-Throw Analog Switch; Manufacturer: NXP SEMICONDUCTORS; PressFit: No; Bonding: No; Table: Standard Logic; Part Number: 74HC4066PW; Component Kind: Standard; Component Type: Standard; Device: 74HC4066PW; PackageDescription: SOP, 14-Leads, Body 4.4x5mm (max), Pitch 0.65mm, IPC Medium Density; Manufacturer Part Number: 74HC4066PW; Pin Count: 14; Case: TSSOP14; Mounted: Yes; Socket: No; SMD: Yes; ComponentHeight: 1.1mm; Author: CERN DEM JLC; HelpURL: \\cern.ch\dfs\Applications\Altium\Datasheets\74HC4066PW.pdf; CreateDate: 2014-11-19; LatestRevisionDate: 2014-11-19
IC29 IC32 = 24AA02E48T-I/OT: 1.7V-5.5V, 2K I2C Serial EEPROM With EUI-48 Node Identity; Manufacturer: MICROCHIP TECHNOLOGY; PressFit: No; Bonding: No; Part Number: 24AA02E48T-I/OT; Component Kind: Standard; Component Type: Standard; Device: 24AA02E48T-I/OT; PackageDescription: SOT, 0.95mm pitch; 5 pin, 1.60mm W X 2.90mm L X 1.45mm H body, IPC Medium Density; Part Description: 1.7V-5.5V, 2K I2C Serial EEPROM With EUI-48 Node Identity; Manufacturer Part Number: 24AA02E48T-I/OT; Pin Count: 5; Case: SOT23-5; Mounted: Yes; Socket: No; SMD: Yes; Sense: No; ComponentHeight: 1.45mm; HelpURL: \\cern.ch\dfs\Applications\Altium\Datasheets\24AA02E48T-I-OT.pdf; Author: CERN DEM MR; CreateDate: 31.03.2016; LatestRevisionDate: 31.03.2016
J6 J37 = 3M_N2530-6002RB: Connector 30 Male; Part Description: 30 Contacts - Straight .100'' x .100'' Low Profile Four-Wall Header, 2500 Series; Manufacturer: 3M; PressFit: No; Part Number: 3M_N2530-6002RB; Component Kind: Standard; Component Type: Standard; Pin Count: 30; Family: Header 30; Mounted: Yes; Socket: No; SMD: No; Sense: No; Status: None; Manufacturer Part Number: N2530-6002RB; ComponentHeight: 10.03mm; HelpURL: \\cern.ch\dfs\Applications\Altium\Datasheets\3M_N2530-6002RB.pdf; Author: CERN DEM JLC; CreateDate: 11.02.2009; LatestRevisionDate: 11.08.2009
R6 R16-R23 R95 R96 R98 R102 R103 R105 R106 R108 R109 R111 R112 R124 R126 R127 R129 R130 R133 R134 R141 R144 R147 R151 R157 R160 R163 R166 R170 = R0402_100R_1%_0.1W_100PPM: Resistor - 1%; Part Description: General Purpose Thick Film Chip Resistor; Manufacturer: GENERIC; Manufacturer Part Number: R0402_100R_1%_0.1W_100PPM_50V; Manufacturer1 Part Number: ERJ2RKF1000X; Power: 0.1W; TC: ±100ppm/°C; Voltage: 50V; Part Number: R0402_100R_1%_0.1W_100PPM; Component Kind: Standard; Component Type: Standard; Pin Count: 2; Value: 100; Status: Not recommended; Tolerance: ±1%; Case: 0402; Mounted: Yes; Sense: No; Socket: No; SMD: Yes; Manufacturer1 Example: PANASONIC; Manufacturer1 ComponentHeight: 0.4mm; HelpURL: \\cern.ch\dfs\Applications\Altium\Datasheets\R0402_PANASONIC_ERJ2RK.pdf; Author: CERN DEM JLC; CreateDate: 12.12.2013; LatestRevisionDate: 03.03.2015
R11 R13 R14 R51 R88 R97 R99-R101 R104 R107 R110 R125 R128 R131 R135 = R0402_0R_JUMPER: Resistor; Part Description: 1A (0.05R Max DC Resistance) Zero Ohm Jumper; Manufacturer: GENERIC; Manufacturer1 Part Number: 232270591001L; Part Number: R0402_0R_JUMPER; Component Kind: Standard; Component Type: Standard; Pin Count: 2; Value: 0; Status: Not recommended; Manufacturer Part Number: R0402_0R_JUMPER; Case: 0402; Mounted: Yes; Sense: No; Socket: No; SMD: Yes; Manufacturer1 Example: YAGEO PHYCOMP; Manufacturer1 ComponentHeight: 0.4mm; HelpURL: \\cern.ch\dfs\Applications\Altium\Datasheets\R0402_Phycomp_RC0402.pdf; Author: CERN DEM JLC; CreateDate: 03.12.2007; LatestRevisionDate: 17.10.2012
R45-R50 R52-R57 R59-R66 R71 R72 R136-R140 R142 R143 R145 R146 R148 R149 R152 R154-R156 R158 = R0402_0R_JUMPER: Resistor; Part Description: 1A (0.05R Max DC Resistance) Zero Ohm Jumper; Manufacturer: GENERIC; Manufacturer1 Part Number: 232270591001L; PressFit: No; Part Number: R0402_0R_JUMPER; Component Kind: Standard; Component Type: Standard; Pin Count: 2; Value: 0; Status: Not Recommended; Manufacturer Part Number: R0402_0R_JUMPER; Case: 0402; Mounted: Yes; Sense: No; Socket: No; SMD: Yes; Manufacturer1 Example: YAGEO PHYCOMP; Manufacturer1 ComponentHeight: 0.4mm; HelpURL: \\cern.ch\dfs\Applications\Altium\Datasheets\R0402_Phycomp_RC0402.pdf; Author: CERN DEM JLC; CreateDate: 03.12.2007; LatestRevisionDate: 17.10.2012
R132 R171 = R0402_10K_1%_0.0625W_100PPM: Resistor - 1%; Part Description: General Purpose Thick Film Chip Resistor; Manufacturer: GENERIC; Manufacturer1 Part Number: 232270671003L; TC: ±100ppm/°C; Part Number: R0402_10K_1%_0.0625W_100PPM; Component Kind: Standard; Component Type: Standard; Pin Count: 2; Value: 10k; Status: Not recommended; Power: 0.0625W; Tolerance: ±1%; Manufacturer Part Number: R0402_10K_1%_0.0625W_100PPM; Case: 0402; Mounted: Yes; Sense: No; Socket: No; SMD: Yes; Manufacturer1 Example: YAGEO PHYCOMP; Manufacturer1 ComponentHeight: 0.4mm; HelpURL: \\cern.ch\dfs\Applications\Altium\Datasheets\R0402_Phycomp_RC0402.pdf; Author: CERN DEM JLC; CreateDate: 03.12.2007; LatestRevisionDate: 17.10.2012
TP11-TP14 TP19-TP21 = SMD_PAD_1.27X1.27MM: Part Description: 1.27mm x 1.27mm PCB Copper Area (SMD Test Point); Mounted: No; Part Number: SMD_PAD_1.27X1.27MM; Component Type: Standard (No BOM); Pin Count: 1; Family: Test Point; Socket: No; SMD: Yes; Sense: No; Status: None; ComponentHeight: 0mm; HelpURL: Undefined; Author: CERN DEM JLC; CreateDate: 12.01.2008; LatestRevisionDate: 12.01.2008; PackageDescription: 1.27mm x 1.27mm PCB Copper Area (SMD Test Point)

## Sheet Filter_simulations.SchDoc: Simulations
size 420 x 297 mm; Author: G.K.; CompanyName: WUT; DrawnBy: G.K.; Organization: WUT ISE; Address1: Warsaw Univeristy of Technology; Address2: Nowowiejska 15/19; DocumentNumber: 5; Revision: 1.4.3; SheetNumber: 5; SheetTotal: 6; EDA_Number: ARTIQ; Projet: Zotino; ModifiedBy: -; CreateDate: XX/XX/XXXX; CheckedDate: -; DivGrp: ISE; Designer: G.K.; ModifiedDate: -; ProjectName: 32 CHANNEL 16bit DAC
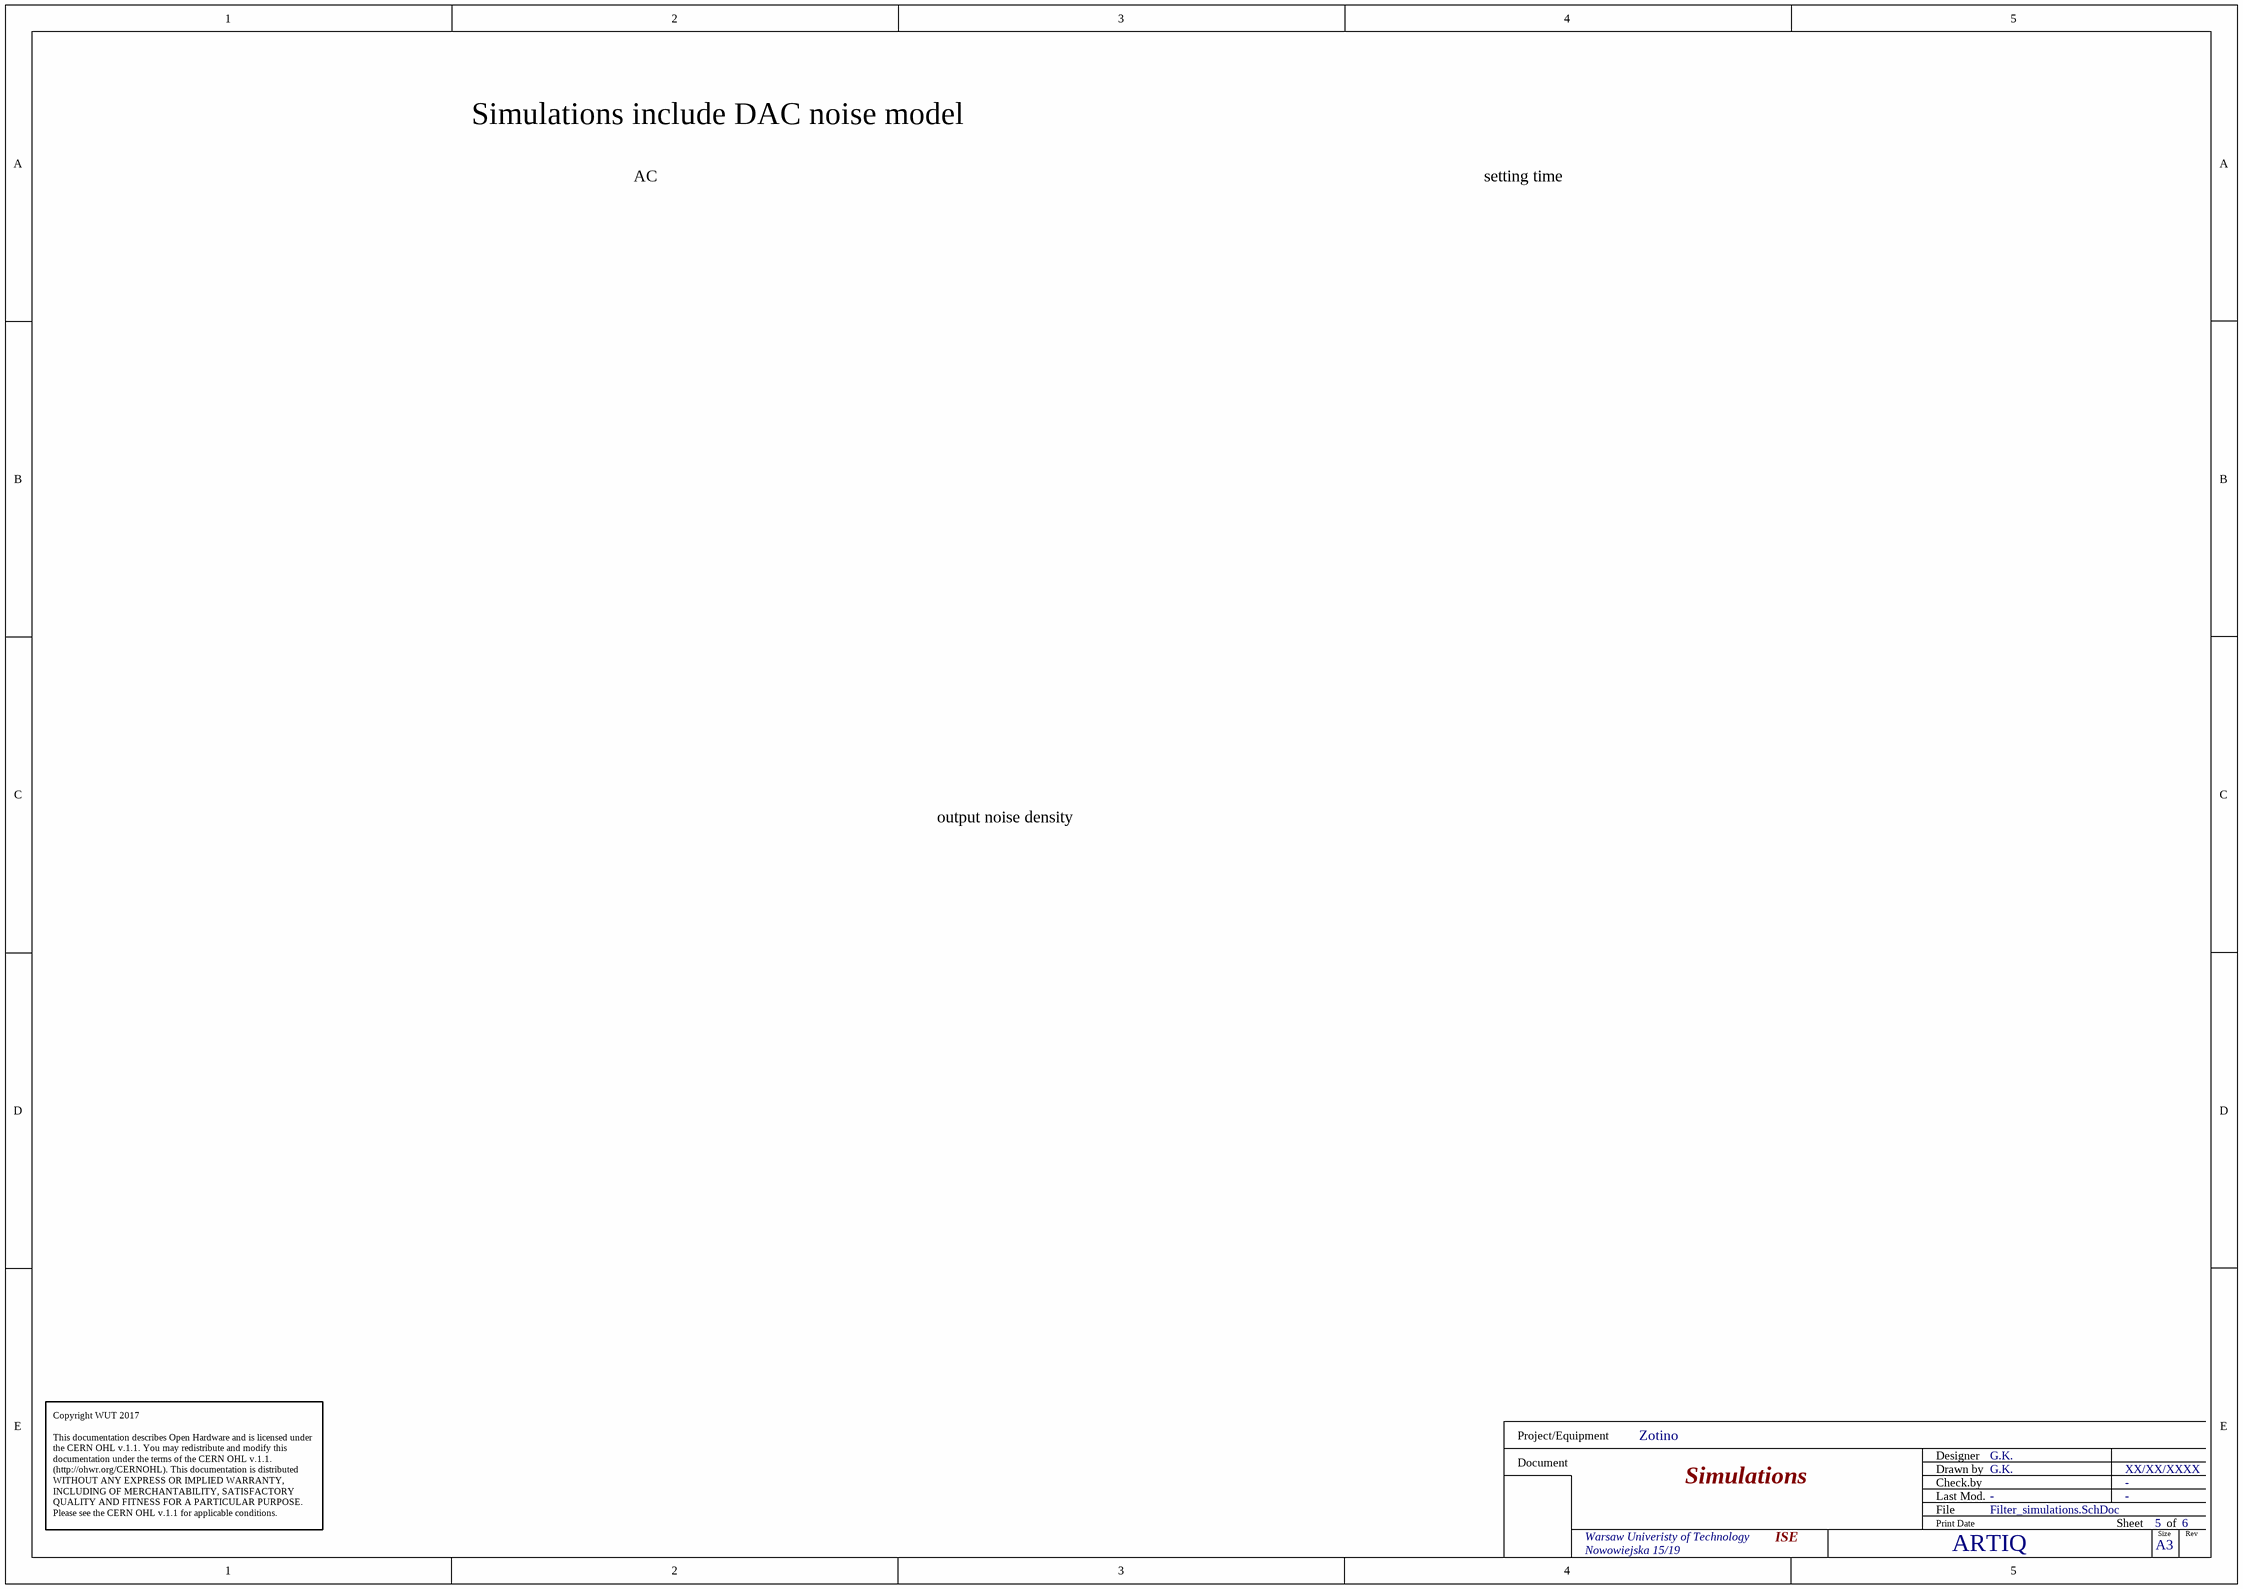
[diagram p5: Filter_simulations.SchDoc]

### Notes on the sheet
- Simulations include DAC noise model
- AC
- setting time
- output noise density
- Copyright WUT 2017
  This documentation describes Open Hardware and is licensed under the CERN OHL v.1.1. You may redistribute and modify this documentation under the terms of the CERN OHL v.1.1. (http://ohwr.org/CERNOHL). This documentation is distributed WITHOUT ANY EXPRESS OR IMPLIED WARRANTY, INCLUDING OF MERCHANTABILITY, SATISFACTORY QUALITY AND FITNESS FOR A PARTICULAR PURPOSE. Please see the CERN OHL v.1.1 for applicable conditions.
- Project/Equipment
- Document
- Designer
- Drawn by
- Check.by
- File
- Last Mod.
- Print Date
- Sheet
- Size
- A3
- of
- Rev